# EAGLE design Propulsion Control Board (final) (EAGLE 9.6.2)
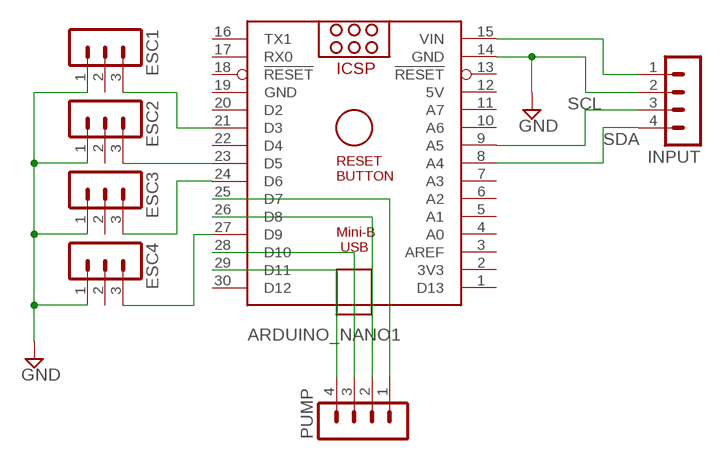
[diagram p0: schematic, sheet 1]

## Parts
ARDUINO_NANO1  ARDUINO_NANO  [ARDUINO_NANO]
ESC1  MA03-1  [MA03-1]
ESC2  MA03-1  [MA03-1]
ESC3  MA03-1  [MA03-1]
ESC4  MA03-1  [MA03-1]
INPUT  MA04-1  [MA04-1]
PUMP  MA04-1  [MA04-1]

## Nets
GND: ARDUINO_NANO1.14(GND) ESC1.1 ESC2.1 ESC3.1 ESC4.1 INPUT.2
N$1: ARDUINO_NANO1.21(D3) ESC1.3
N$2: ARDUINO_NANO1.23(D5) ESC2.3
N$3: ARDUINO_NANO1.24(D6) ESC3.3
N$4: ARDUINO_NANO1.27(D9) ESC4.3
N$6: ARDUINO_NANO1.25(D7) PUMP.1
N$7: ARDUINO_NANO1.26(D8) PUMP.2
N$8: ARDUINO_NANO1.28(D10) PUMP.3
N$9: ARDUINO_NANO1.29(D11) PUMP.4
N$14: ARDUINO_NANO1.15(VIN) INPUT.1
SCL: ARDUINO_NANO1.9(A5) INPUT.3
SDA: ARDUINO_NANO1.8(A4) INPUT.4
Unconnected: ARDUINO_NANO1.1(D13) ARDUINO_NANO1.2(3V3) ARDUINO_NANO1.3(AREF) ARDUINO_NANO1.4(A0) ARDUINO_NANO1.5(A1) ARDUINO_NANO1.6(A2) ARDUINO_NANO1.7(A3) ARDUINO_NANO1.10(A6) ARDUINO_NANO1.11(A7) ARDUINO_NANO1.13(!RESET) ARDUINO_NANO1.16(TX1) ARDUINO_NANO1.17(RX0) ARDUINO_NANO1.18(!RESET) ARDUINO_NANO1.20(D2) ARDUINO_NANO1.22(D4) ARDUINO_NANO1.30(D12) ESC1.2 ESC2.2 ESC3.2 ESC4.2

## Power pins joined to a net without a drawn wire
5V: ARDUINO_NANO1.12(5V)
GND: ARDUINO_NANO1.19(GND)

## Library data of the parts
ARDUINO_NANO1 = ArduinoNanoV30:ARDUINO_NANO: Arduino Nano V3.0 Overview: The Arduino Nano is a small, complete, and breadboard-friendly board based on the ATmega328 (Arduino Nano 3.x) or ATmega168 (Arduino Nano 2.x). It has more or less the same functionality of the Arduino Duemilanove, but in a different package. It lacks only a DC power jack, and works with a Mini-B USB cable instead of a standard one. The Nano was designed and is being produced by Gravitech. Specifications: Microcontroller Atmel ATmega168 or ATmega328 Operating Voltage (logic level) 5 V Input Voltage (recommended) 7-12 V Input Voltage (limits) 6-20 V Digital I/O Pins 14 (of which 6 provide PWM output) Analog Input Pins 8 DC Current per I/O Pin 40 mA Flash Memory 16 KB (ATmega168) or 32 KB (ATmega328) of which 2 KB used by bootloader SRAM 1 KB (ATmega168) or 2 KB (ATmega328) EEPROM 512 bytes (ATmega168) or 1 KB (ATmega328) Clock Speed 16 MHz Dimensions 0.73" x 1.70" Length 45 mm Width 18 mm Weigth 5 g Power: The Arduino Nano can be powered via the Mini-B USB connection, 6-20V unregulated external power supply (pin 30), or 5V regulated external power supply (pin 27). The power source is automatically selected to the highest voltage source. Memory: The ATmega168 has 16 KB of flash memory for storing code (of which 2 KB is used for the bootloader); the ATmega328 has 32 KB, (also with 2 KB used for the bootloader). The ATmega168 has 1 KB of SRAM and 512 bytes of EEPROM (which can be read and written with the EEPROM library); the ATmega328 has 2 KB of SRAM and 1 KB of EEPROM. Input and Output: Each of the 14 digital pins on the Nano can be used as an input or output, using pinMode(), digitalWrite(), and digitalRead() functions. They operate at 5 volts. Each pin can provide or receive a maximum of 40 mA and has an internal pull-up resistor (disconnected by default) of 20-50 kOhms. In addition, some pins have specialized functions. Visit Arduino - ArduinoBoardNano <https://www.arduino.cc/en/Main/ArduinoBoardNano>
ESC1-ESC4 = con-lstb:MA03-1: PIN HEADER; OC_FARNELL: unknown; OC_NEWARK: unknown
INPUT PUMP = con-lstb:MA04-1: PIN HEADER; OC_FARNELL: unknown; OC_NEWARK: unknown

## Board
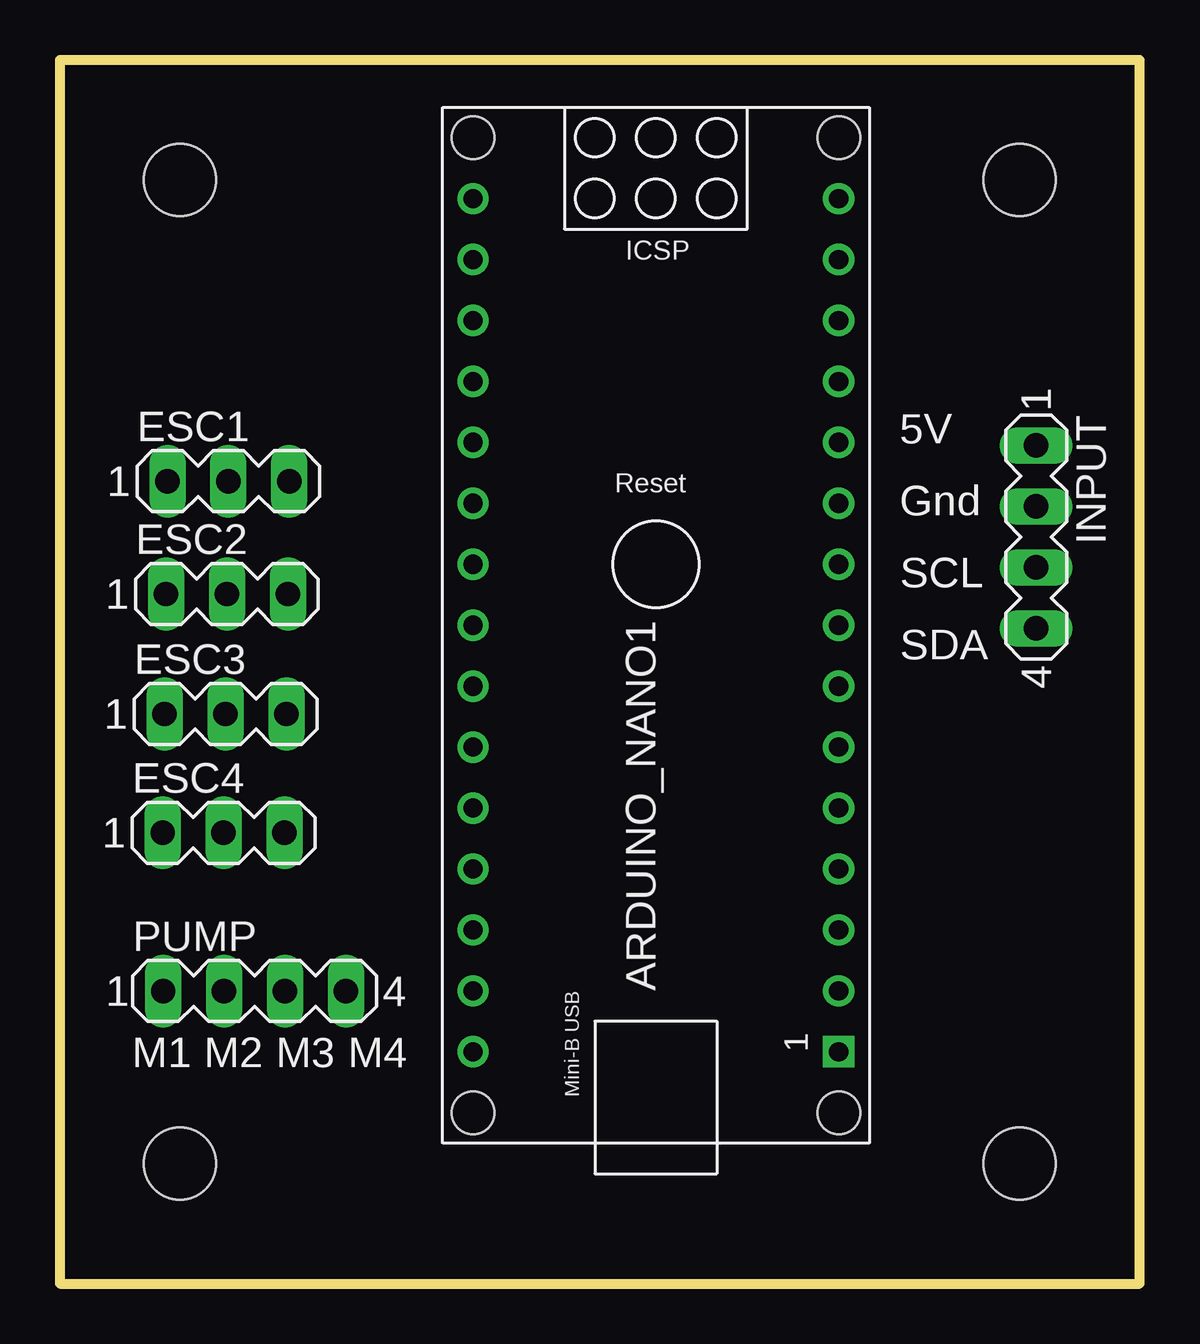
[diagram p1: board, top side]
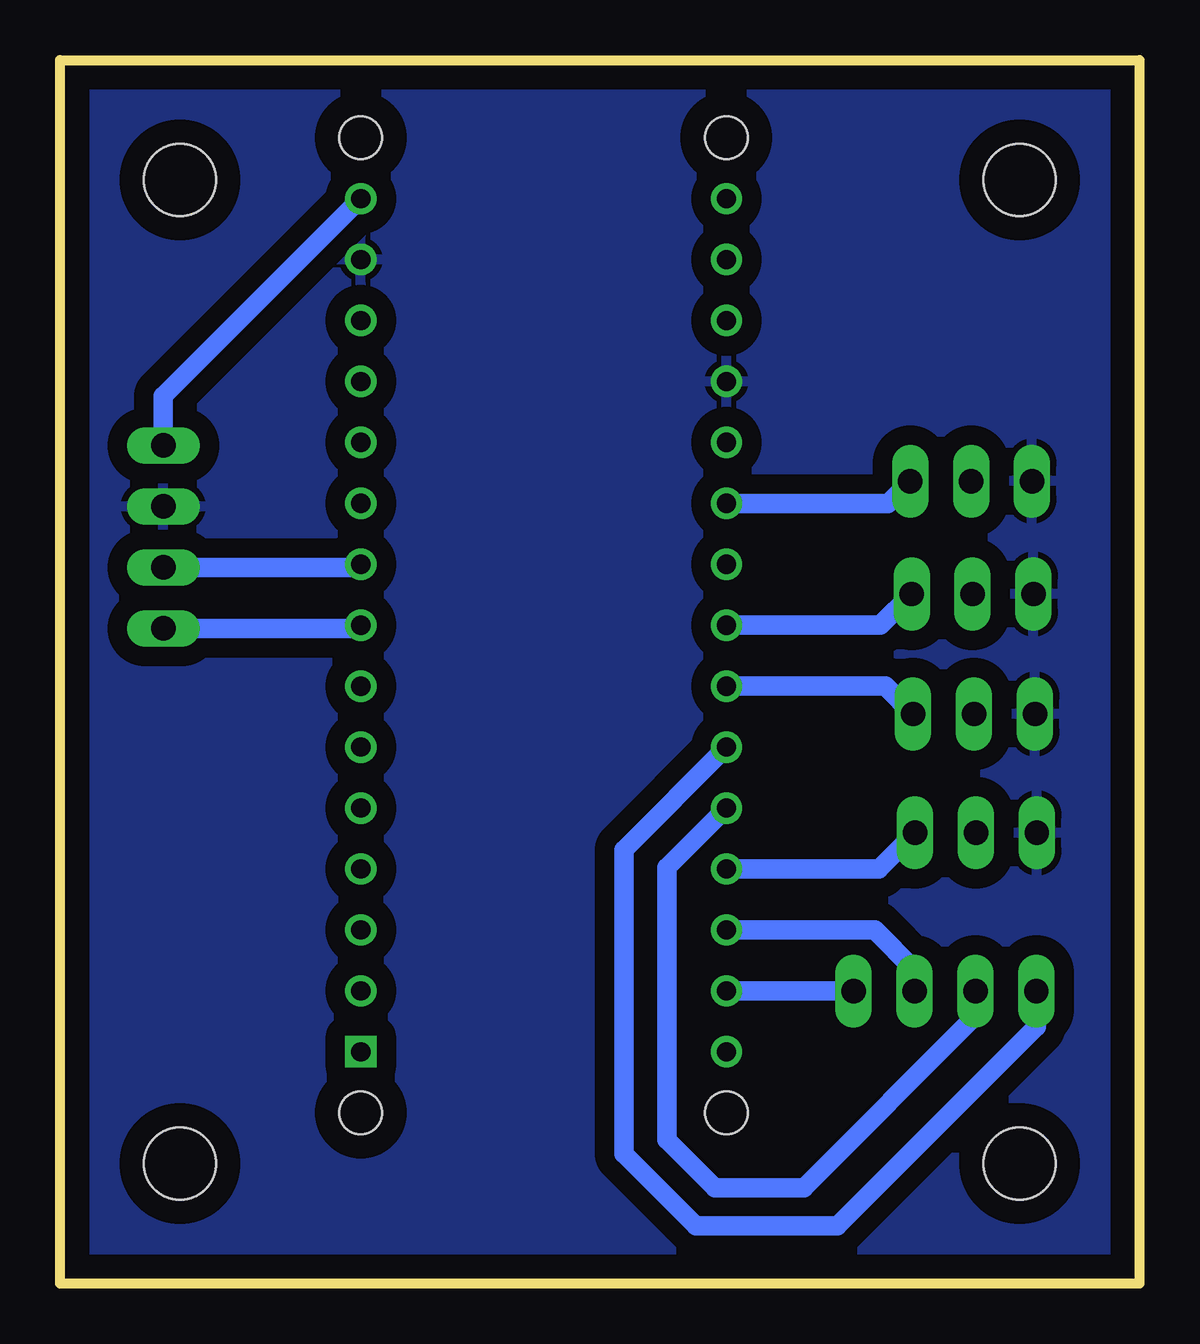
[diagram p2: board, bottom side, seen from below]

Size 45 x 51 mm. Coordinates in mm from the lower left corner, seen from the top.
Outline: 0,0 45,0 45,51 0,51 0,0
Copper layers (1*16): Top 0.035mm / dielectric 1.5mm / Bottom 0.035mm
Design rules "default": minimum track width 6mil, minimum drill 0.35mm, track to track 6mil, track to pad 6mil, pad to pad 6mil, via to via 6mil, smd to smd 6mil, copper to edge 40mil, drill to drill 6mil, minimum pad ring 10mil, minimum via ring 8mil, stop-mask expansion 4mil, vias tented up to drill 0mil, thermal gap 10mil
Holes 3 mm at 5,46 40,46 5,5 40,5

### Footprints (pad centres in the part's own frame; a part is rotated, then mirrored left to right if it is on the bottom)
ARDUINO_NANO = drill 0.8 square: 1 -20.32,-7.62 | drill 0.8: 2 -17.78,-7.62; 3 -15.24,-7.62; 4 -12.7,-7.62; 5 -10.16,-7.62; 6 -7.62,-7.62; 7 -5.08,-7.62; 8 -2.54,-7.62; 9 0,-7.62; 10 2.54,-7.62; 11 5.08,-7.62; 12 7.62,-7.62; 13 10.16,-7.62; 14 12.7,-7.62; 15 15.24,-7.62; 16 15.24,7.62; 17 12.7,7.62; 18 10.16,7.62; 19 7.62,7.62; 20 5.08,7.62; 21 2.54,7.62; 22 0,7.62; 23 -2.54,7.62; 24 -5.08,7.62; 25 -7.62,7.62; 26 -10.16,7.62; 27 -12.7,7.62; 28 -15.24,7.62; 29 -17.78,7.62; 30 -20.32,7.62 | hole 1.778: -22.86,-7.62; -22.86,7.62; 17.78,7.62; 17.78,-7.62
MA03-1 = drill 1.016 long: 1 -2.54,0; 2 0,0; 3 2.54,0
MA04-1 = drill 1.016 long: 1 -3.81,0; 2 -1.27,0; 3 1.27,0; 4 3.81,0

### Placement (x,y rotation side)
ARDUINO_NANO1  24.84,29.98 90 top
ESC1  7.02,33.44 0 top
ESC2  6.96,28.74 0 top
ESC3  6.9,23.74 0 top
ESC4  6.82,18.79 0 top
INPUT  40.69,31.12 270 top
PUMP  8.11,12.19 0 top

### Tracks (layer width: path | path; a pad name or v marks a point on that pad's centre or on a via)
GND
  pour Bottom (isolate 0.813): 0,0 45,0 45,51 0,51
N$1
  Bottom 0.813: ESC1.3 10.48,32.52 ARDUINO_NANO1.21
N$2
  Bottom 0.813: ESC2.3 10.8,27.44 ARDUINO_NANO1.23
N$3
  Bottom 0.813: ESC3.3 10.6,24.9 ARDUINO_NANO1.24
N$4
  Bottom 0.813: ESC4.3 10.87,17.28 ARDUINO_NANO1.27
N$6
  Bottom 0.813: ARDUINO_NANO1.25 21.5,18.08 21.5,5.4 18.5,2.4 12.6,2.4 4.3,10.7 PUMP.1
N$7
  Bottom 0.813: ARDUINO_NANO1.26 19.7,17.34 19.7,6 17.7,4 14,4 6.84,11.16 PUMP.2
N$8
  Bottom 0.813: PUMP.3 9.38,13.08 11.04,14.74 ARDUINO_NANO1.28
N$9
  Bottom 0.813: ARDUINO_NANO1.29 PUMP.4
N$14
  Bottom 0.813: ARDUINO_NANO1.15 40.69,36.99 INPUT.1
SCL
  Bottom 0.813: ARDUINO_NANO1.9 32.59,29.85 INPUT.3
SDA
  Bottom 0.813: ARDUINO_NANO1.8 32.59,27.31 INPUT.4

### Text on the board
tNames: 5V | Gnd | SCL | SDA | M1 | M2 | M3 | M4